# Altium schematic sheet USB_C_GNSS.SchDoc
size A4; DocumentNumber: 9; SheetNumber: 9; SheetTotal: 12
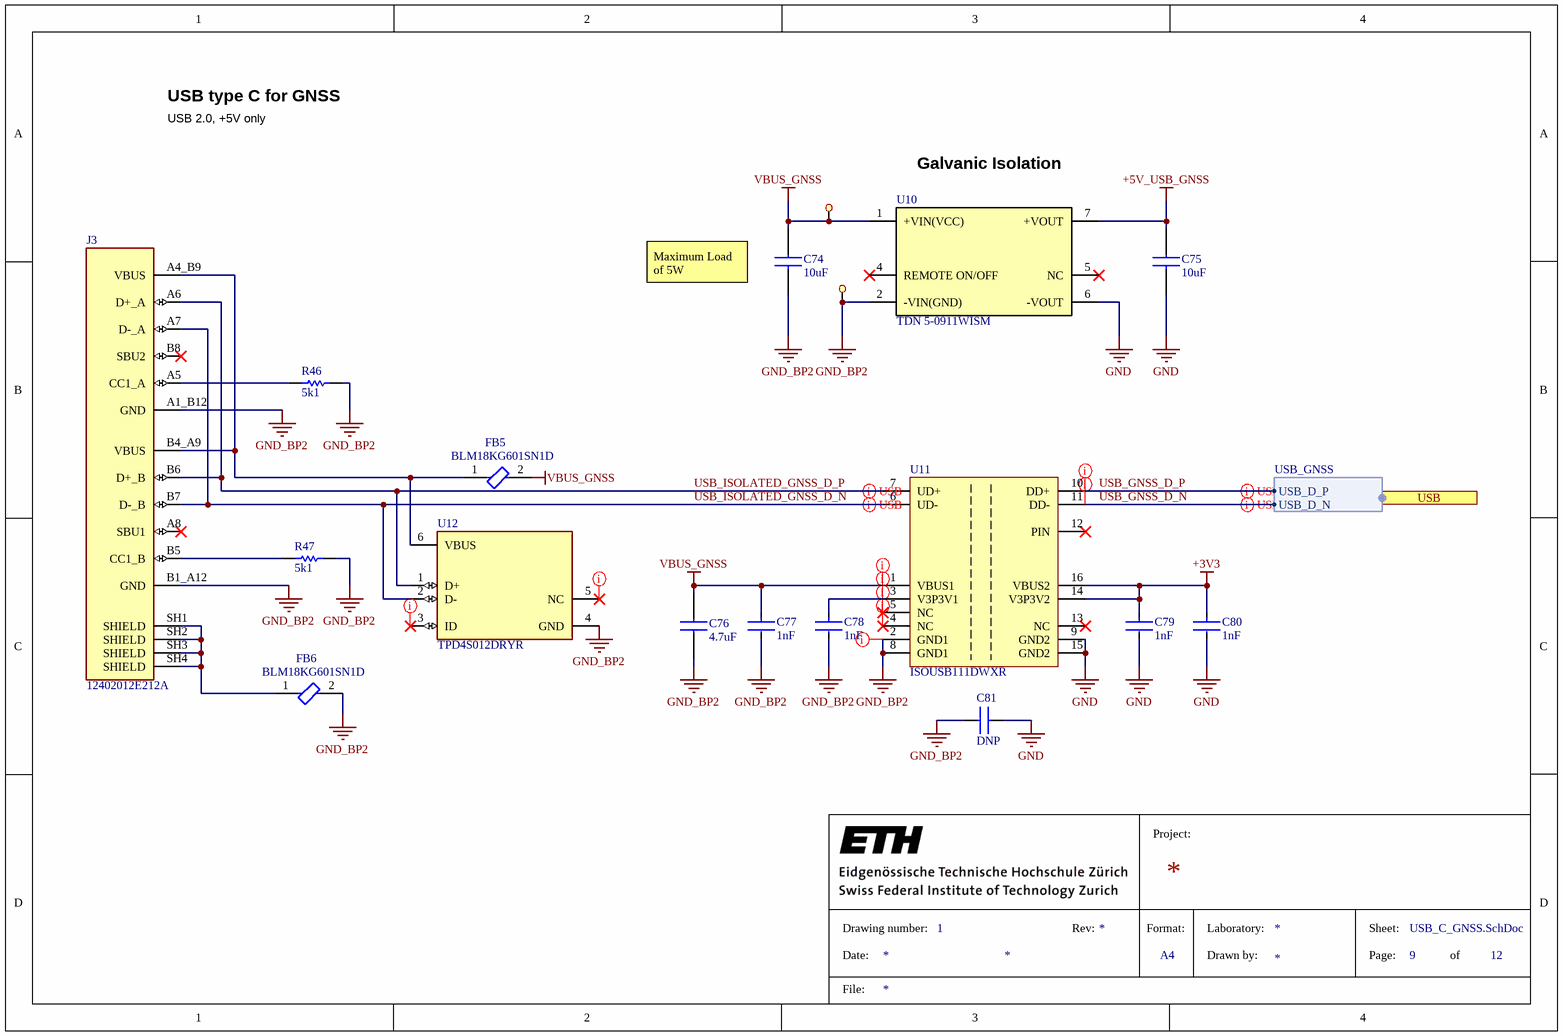
[diagram p0: USB_C_GNSS.SchDoc]

## Parts
*22  testpoint  [testpoint]  (value not drawn)
*24  testpoint  [testpoint]  (value not drawn)
C74  10uF  [CAPC2013X140N]
C75  10uF  [CAPC2013X140N]
C76  4.7uF  [CAPC1608X95N]
C77  1nF  [FP-C0805C-DN-MFG]
C78  1nF  [FP-C0805C-DN-MFG]
C79  1nF  [FP-C0805C-DN-MFG]
C80  1nF  [FP-C0805C-DN-MFG]
C81  DNP  [CAPC3216X180N]
FB5  BLM18KG601SN1D  [FP-BLM18-0_15-t0_8-IPC_A]
FB6  BLM18KG601SN1D  [FP-BLM18-0_15-t0_8-IPC_A]
J3  12402012E212A  [AMPHENOL_12402012E212A]
R46  5k1  [ERJUP6]
R47  5k1  [ERJUP6]
U10  TDN 5-0911WISM  [TDN 5WISM SINGLE_TRP]
U11  ISOUSB111DWXR  [DWX0016A]
U12  TPD4S012DRYR  [FP-DRY0006A-MFG]

## Ports
USB (harness USB_GNSS, see MAIN[6C], GNSS_ZED-X20P[1A])

## Harnesses
USB_GNSS: USB_D_P, USB_D_N

## Nets
+3V3: C79.1 C80.1 U11.14(V3P3V2) U11.16(VBUS2)
+5V_USB_GNSS: C75.2 U10.7(+VOUT)
GND: C75.1 C79.2 C80.2 C81.1 U10.6(-VOUT) U11.9(GND2) U11.15(GND2)
GND_BP2: *24.1 C74.1 C76.1 C77.2 C78.2 C81.2 FB6.2 J3.A1_B12(GND) J3.B1_A12(GND) R46.1 R47.1 U10.2(-VIN(GND)) U11.2(GND1) U11.8(GND1) U12.4(GND)
VBUS_GNSS: *22.1 C74.2 C76.2 C77.1 FB5.2 U10.1(+VIN(VCC)) U11.1(VBUS1)
USB_GNSS_D_N: U11.11(DD-) ; port USB.USB_D_N
USB_GNSS_D_P: U11.10(DD+) ; port USB.USB_D_P
USB_ISOLATED_GNSS_D_N: J3.A7(D-_A) J3.B7(D-_B) U11.6(UD-) U12.2(D-)
USB_ISOLATED_GNSS_D_P: J3.A6(D+_A) J3.B6(D+_B) U11.7(UD+) U12.1(D+)
NetC78_1: C78.1 U11.3(V3P3V1)
NetFB5_1: FB5.1 J3.A4_B9(VBUS) J3.B4_A9(VBUS) U12.6(VBUS)
NetFB6_1: FB6.1 J3.SH1(SHIELD) J3.SH2(SHIELD) J3.SH3(SHIELD) J3.SH4(SHIELD)
NetJ3_A5: J3.A5(CC1_A) R46.2
NetJ3_B5: J3.B5(CC1_B) R47.2

Not connected (* = marked no-connect by the designer): J3 A8(SBU1)* B8(SBU2)*; U10 4(REMOTE_ON/OFF)* 5(NC)*; U11 4(NC)* 5(NC)* 12(PIN)* 13(NC)*; U12 3(ID)* 5(NC)*

## Layout directives
net class USB_isolated: NetC78_1, NetU11_4, NetU11_5, NetU12_3, NetU12_5, VBUS_GNSS
mark named USB: GND_BP2
net class D90: USB_GNSS_D_N, USB_GNSS_D_P
differential pair; differential pair class USB_90R_isolated; rule Matched Net Lengths [Tolerance = 100mil]; net class USB_90R_isolated: USB_ISOLATED_GNSS_D_N, USB_ISOLATED_GNSS_D_P
differential pair; differential pair class USB_90R; rule Matched Net Lengths [Tolerance = 100mil]; net class USB_90R: USB_GNSS_D_N, USB_GNSS_D_P

## Notes on the sheet
- USB type C for GNSS
- USB 2.0, +5V only
- (near U10) Galvanic Isolation
- (near C74) Maximum Load of 5W
- Project:
- Drawing number:
- Date:
- 1
- Rev:
- Format:
- A4
- Laboratory:
- Drawn by:
- Sheet:
- Page:
- of
- File:

## Library data of the parts
C74 C75 = LMK212AB7106MG-T: Capacitor 10uF 0805; Manufacturer_Name: TAIYO YUDEN; Datasheet Link: https://datasheet.datasheetarchive.com/originals/distributors/Datasheets-DGA20/25674.pdf; Height: 1.4mm; Mouser Part Number: 963-LMK212AB7106MG-T; Mouser Price/Stock: https://www.mouser.co.uk/ProductDetail/Taiyo-Yuden/LMK212AB7106MG-T?qs=CNQs48zzdnrud19jlu61Cg%3D%3D; Manufacturer Part Number: LMK212AB7106MG-T; Supplier 1: Digikey; Supplier Part Number 1: 587-3417-1-ND
C76 = CL10B475KQ8NQNC: Capacitor 4.7uF 0603; Manufacturer_Name: SAMSUNG; Datasheet Link: https://datasheet.datasheetarchive.com/originals/distributors/Datasheets-DGA10/2410603.pdf; Height: 0.95mm; Manufacturer Part Number: CL10B475KQ8NQNC; Mouser Part Number: 187-CL10B475KQ8NQNC; Mouser Price/Stock: https://www.mouser.co.uk/ProductDetail/Samsung-Electro-Mechanics/CL10B475KQ8NQNC?qs=6tbHoouHnQxd6rcaSwpT7Q%3D%3D; Arrow Part Number: CL10B475KQ8NQNC; Arrow Price/Stock: https://www.arrow.com/en/products/cl10b475kq8nqnc/samsung-electro-mechanics; Supplier 1: Digikey; Supplier Part Number 1: 1276-2087-1-ND
C77-C80 = CMP-2007-00235-2: Capacitor 1nF 0805; Manufacturer: KEMET; Manufacturer Part Number: C0805C102J5GACTU; Value: 1,000 pF; Voltage Rating: 50 V; Temperature Characteristic: C0G; Material: Ceramic; Temperature Coefficient: 30ppm/°C; Tolerance: 0.05; Automotive: No; Device Class L1: Passive Components; Digikey Description: CAP CER 1000PF 50V C0G/NP0 0805; Lead Free: Yes; Capacitance: 1,000 pF; Package: C0805C-DN; RoHS: TRUE; Temperature Range High: +125°C; Height: 0.88mm; Ipc Land Pattern Name: CAPC200125X78; Category: Cap; ComponentLink2URL: https://content.kemet.com/datasheets/KEM_C1003_C0G_SMD.pdf; Device Class L2: Capacitors; ComponentLink2Description: Datasheet; Temperature: -55°C to +125°C; Octopart: https://octopart.com/c0805c102j5gactu-kemet-97757; Mouser Description: Multilayer Ceramic Capacitors MLCC - SMD/SMT 50volts 1000pF C0G 5%; Device Class L3: Ceramic Capacitors; Temperature Range Low: -55°C; Supplier 1: Mouser; Supplier Part Number 1: 80-C0805C102J5G
C81 = CL31B102KJHNNNE: Capacitor 1nF/2kV 3216 Isolated GND Loop Cap; Manufacturer_Name: SAMSUNG; Datasheet Link: https://www.tme.com/Document/4a42202b32dab16128fe107dd69598cc/samsung-chip-cap.pdf; Height: 1.8mm; Manufacturer Part Number: CL31B102KJHNNNE; Mouser Part Number: 187-CL31B102KJHNNNE; Mouser Price/Stock: https://www.mouser.co.uk/ProductDetail/Samsung-Electro-Mechanics/CL31B102KJHNNNE?qs=X6jEic%2FHinAYVHtIjHgytw%3D%3D; Arrow Part Number: CL31B102KJHNNNE; Arrow Price/Stock: https://www.arrow.com/en/products/cl31b102kjhnnne/samsung-electro-mechanics?utm_currency=USD&region=nac; Supplier 1: DigiKey; Supplier Part Number 1: 1276-3073-1-ND
FB5 FB6 = CMP-0686-00581-3: Chip Ferrite Bead, 0603, 600Ω @ 100MHz, 0.15Ω, 25%, 1.3A; Material: Steel; Number of Lines: 1; Impedance: 600R; DC Resistance (DCR): 150mR; Tolerance: 25%; Case Code (Metric): 1608; Width: 0.8mm; DC Current: 1.3A; Max DC Current: 1.3A; Package Quantity: 1; Number of Pins: 2; Military Standard: Not; RoHS Compliant: Yes; Termination: SMD/SMT; Max Operating Temperature: 125°C; Length: 1.6mm; Depth: 0.8mm; Case Code (Imperial): 0603; Series: BLM18K; Inductor Type: FERRITE BEAD; Core Material: Ferrite; Number of Circuits: 1; Height: 0.8mm; Case/Package: 0603; REACH SVHC: No SVHC; Packaging: Tape and Reel; Min Operating Temperature: -55°C; Max Current Rating: 1.3A; Radiation Hardening: No; Current Rating: 1.3A; Lead Free: Lead Free; Test Frequency: 100MHz; Weight: 7.1E-05oz
J3 = 12402012E212A: USB2.0, Type C, Top mount, CH 1.68mm, Dual Row SMT; MF: Amphenol ICC (Commercial Products); MP: 12402012E212A; Price: None; Package: None; Availability: In Stock; SnapEDA_Link: https://www.snapeda.com/parts/12402012E212A/Amphenol/view-part/?ref=snap; Value: *; Check_prices: https://www.snapeda.com/parts/12402012E212A/Amphenol/view-part/?ref=eda; Purchase-URL: https://pricing.snapeda.com/search/part/12402012E212A/?ref=eda; Manufacturer Part Number: 12402012E212A; Supplier 1: Digikey; Supplier Part Number 1: 664-12402012E212ACT-ND
R46 R47 = ERJ-UP6D5101V: Resistor 5k1 0805; Manufacturer_Name: Panasonic; Datasheet Link: https://industrial.panasonic.com/cdbs/www-data/pdf/RDP0000/AOA0000C337.pdf; Height: 0.7mm; Mouser Part Number: 667-ERJ-UP6D5101V; Mouser Price/Stock: https://www.mouser.co.uk/ProductDetail/Panasonic/ERJ-UP6D5101V?qs=ZcfC38r4Pouz7%2FLHthUDHQ%3D%3D; Arrow Part Number: ERJ-UP6D5101V; Arrow Price/Stock: https://www.arrow.com/en/products/erj-up6d5101v/panasonic?utm_currency=USD&region=nac; Supplier 1: Mouser; Supplier Part Number 1: 667-ERJ-UP6D5101V; Manufacturer Part Number: ERJ-UP6D5101V
U10 = TDN 5-0911WISM: TDN 5-0911WISM DC-DC Converter, 5V, 1A; No. of Outputs: 1 Output; Output Power Max: 5W; Voltage - 1: 5V; Current 1: 1A;; NexarPartId: 76519263; Number of Outputs: 1; RoHS: Compliant; Output Power: 5W; Width: 9.1mm; Height: 10.2mm; Supplier: DigiKey; Supplier Part Number: TDN5-0911WISM-ND
U11 = ISOUSB111DWXR: Low emissions, full and low speed isolated USB repeater 16-SSOP -40 to 125; Manufacturer: Texas Instruments; Supplier: Digikey; Supplier Part Number: 296-ISOUSB111DWXRCT-ND; Manufacturer Part Number: ISOUSB111DWXR; RoHS: No; Stock: 317; Pricing: 1=10.29, 10=9.294, 25=8.8616, 100=7.6946, 250=7.34876, 500=6.70034 (USD); Supplier 1: Digikey; Supplier Part Number 1: 296-ISOUSB111DWXRCT-ND
U12 = CMP-0326-00038-4: TVS DIODE 5.5V 6SON; Breakdown Voltage: 24V; Interface: USB; ESD Protection: Yes; Peak Pulse Power: 60W; Number of Circuits: 4; Polarity: Unidirectional; Capacitance: 15pF; Test Current: 1mA; Working Voltage: 19V; Min Breakdown Voltage: 6V; Peak Pulse Current: 3A; Operating Supply Voltage: 950mV; Max Operating Temperature: 85°C; Packaging: Tape and Reel; Termination: SMD/SMT; Number of Pins: 6; Radiation Hardening: No; Width: 1.05mm; REACH SVHC: No SVHC; Lead Free: Lead Free; Depth: 1mm; Package Quantity: 5000; Length: 1.45mm; Direction: Unidirectional; Min Operating Temperature: -40°C; Number of Channels: 4; Max Power Dissipation: 60W; Height: 0.55mm; Manufacturer Part Number: TPD4S012DRYR